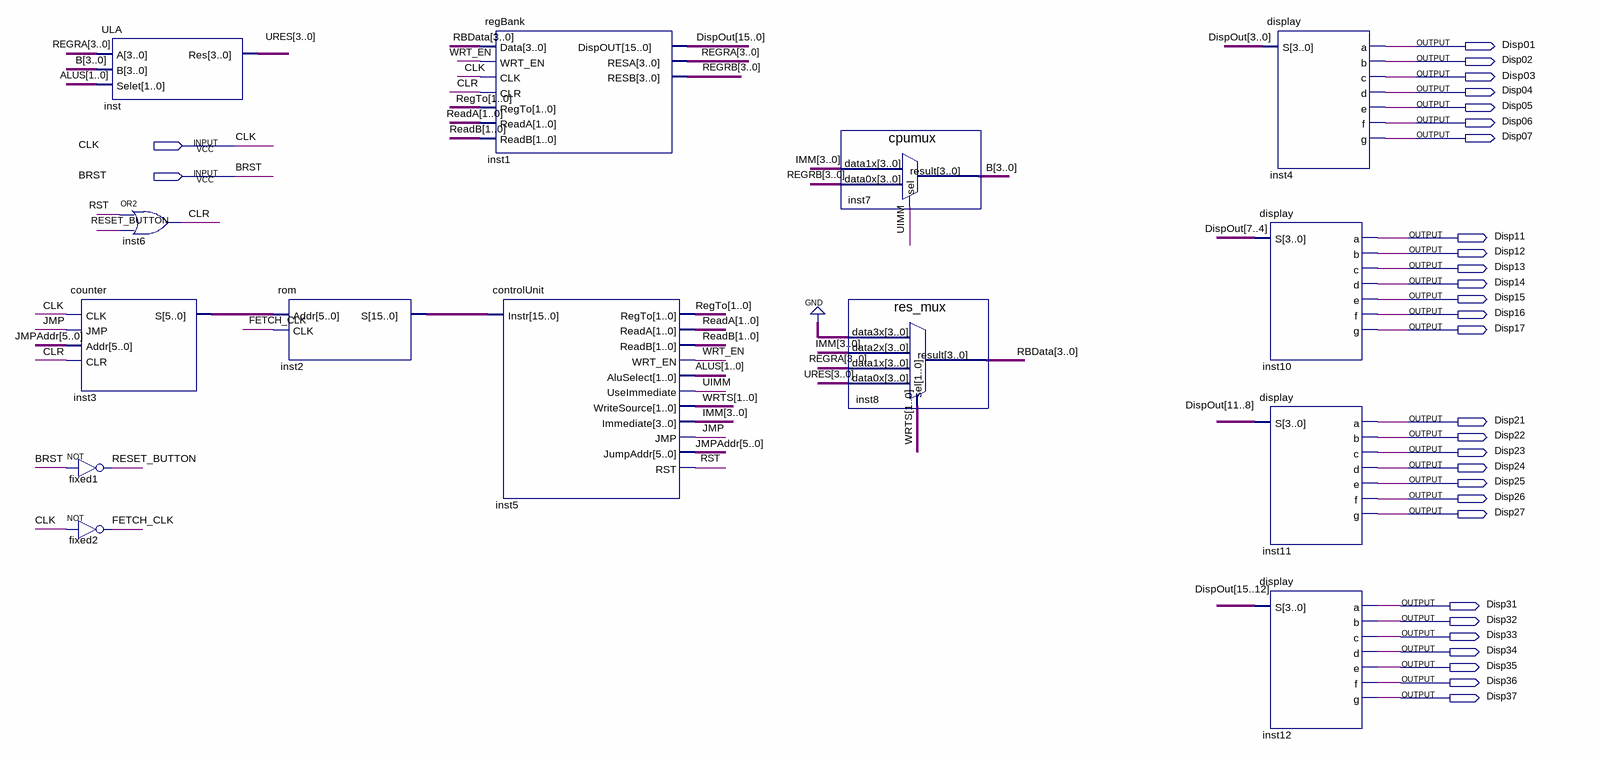
[diagram p0: schematic sheet]
// Quartus schematic miniCPU.bdf as structural Verilog: 14 symbols, 30 pins
module miniCPU (
  input  CLK,
  input  BRST,
  output Disp01,
  output Disp02,
  output Disp03,
  output Disp04,
  output Disp05,
  output Disp06,
  output Disp07,
  output Disp11,
  output Disp12,
  output Disp13,
  output Disp14,
  output Disp15,
  output Disp16,
  output Disp17,
  output Disp21,
  output Disp22,
  output Disp23,
  output Disp24,
  output Disp25,
  output Disp26,
  output Disp27,
  output Disp31,
  output Disp32,
  output Disp33,
  output Disp34,
  output Disp35,
  output Disp36,
  output Disp37
);

  wire CLR, FETCH_CLK, JMP, RESET_BUTTON, RST, UIMM, WRT_EN;
  wire [1:0] ALUS, ReadA, ReadB, RegTo, WRTS;
  wire [3:0] B, IMM, RBData, REGRA, REGRB, URES;
  wire [5:0] inst3_s, JMPAddr;
  wire [15:0] DispOut, inst2_s;

  counter inst3 (.CLK(CLK), .JMP(JMP), .Addr(JMPAddr), .CLR(CLR), .S(inst3_s));
  not fixed1 (RESET_BUTTON, BRST);
  not fixed2 (FETCH_CLK, CLK);
  ULA inst (.A(REGRA), .B(B), .Selet(ALUS), .Res(URES));
  or inst6 (CLR, RST, RESET_BUTTON);
  rom inst2 (.Addr(inst3_s), .CLK(FETCH_CLK), .S(inst2_s));
  regBank inst1 (
    .Data(RBData), .WRT_EN(WRT_EN), .CLK(CLK), .CLR(CLR), .RegTo(RegTo), .ReadA(ReadA), .ReadB(ReadB),
    .DispOUT(DispOut), .RESA(REGRA), .RESB(REGRB));
  controlUnit inst5 (
    .Instr(inst2_s), .RegTo(RegTo), .ReadA(ReadA), .ReadB(ReadB), .WRT_EN(WRT_EN), .AluSelect(ALUS),
    .UseImmediate(UIMM), .WriteSource(WRTS), .Immediate(IMM), .JMP(JMP), .JumpAddr(JMPAddr), .RST(RST));
  cpumux inst7 (.data1x(IMM), .data0x(REGRB), .sel(UIMM), .result(B));
  res_mux inst8 (.data3x(4'b0000), .data2x(IMM), .data1x(REGRA), .data0x(URES), .sel(WRTS), .result(RBData));
  display inst4 (.S(DispOut[3:0]), .a(Disp01), .b(Disp02), .c(Disp03), .d(Disp04), .e(Disp05), .f(Disp06), .g(Disp07));
  display inst10 (.S(DispOut[7:4]), .a(Disp11), .b(Disp12), .c(Disp13), .d(Disp14), .e(Disp15), .f(Disp16), .g(Disp17));
  display inst11 (
    .S(DispOut[11:8]), .a(Disp21), .b(Disp22), .c(Disp23), .d(Disp24), .e(Disp25), .f(Disp26), .g(Disp27));
  display inst12 (
    .S(DispOut[15:12]), .a(Disp31), .b(Disp32), .c(Disp33), .d(Disp34), .e(Disp35), .f(Disp36), .g(Disp37));
endmodule
